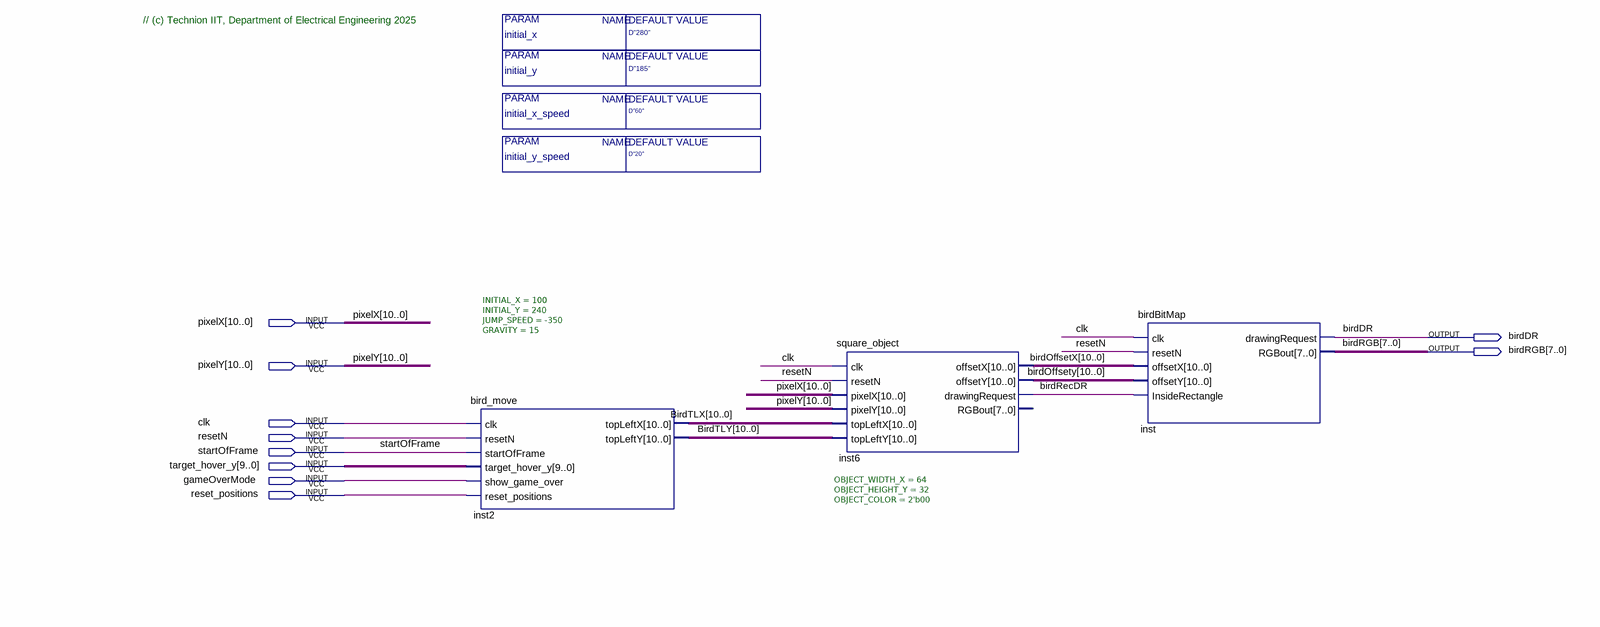
[diagram p0: schematic sheet]
// Quartus schematic BIRD_BLOCK_T.bdf as structural Verilog: 3 symbols, 10 pins
module BIRD_BLOCK_T #(parameter initial_x = "D\"280\"", parameter initial_y = "D\"185\"", parameter initial_x_speed = "D\"60\"", parameter initial_y_speed = "D\"20\"") (
  input  [10:0] pixelX,
  input  [10:0] pixelY,
  input  clk,
  input  resetN,
  input  startOfFrame,
  input  [9:0] target_hover_y,
  input  gameOverMode,
  input  reset_positions,
  output birdDR,
  output [7:0] birdRGB
);

  wire birdRecDR;
  wire [10:0] birdOffsetX, birdOffsety, BirdTLX, BirdTLY;

  bird_move #(.INITIAL_X(100), .INITIAL_Y(240), .JUMP_SPEED(-350), .GRAVITY(15)) inst2 (
    .clk(clk), .resetN(resetN), .startOfFrame(startOfFrame), .target_hover_y(target_hover_y),
    .show_game_over(gameOverMode), .reset_positions(reset_positions), .topLeftX(BirdTLX), .topLeftY(BirdTLY));
  square_object #(.OBJECT_WIDTH_X(64), .OBJECT_HEIGHT_Y(32), .OBJECT_COLOR(2'b00)) inst6 (
    .clk(clk), .resetN(resetN), .pixelX(pixelX), .pixelY(pixelY), .topLeftX(BirdTLX), .topLeftY(BirdTLY),
    .offsetX(birdOffsetX), .offsetY(birdOffsety), .drawingRequest(birdRecDR));  // open: RGBout
  birdBitMap inst (
    .clk(clk), .resetN(resetN), .offsetX(birdOffsetX), .offsetY(birdOffsety), .InsideRectangle(birdRecDR),
    .drawingRequest(birdDR), .RGBout(birdRGB));

  // Notes on the sheet:
  //   // (c) Technion IIT, Department of Electrical Engineering 2025
endmodule
